# Altium project ControlePamis.PrjPcb
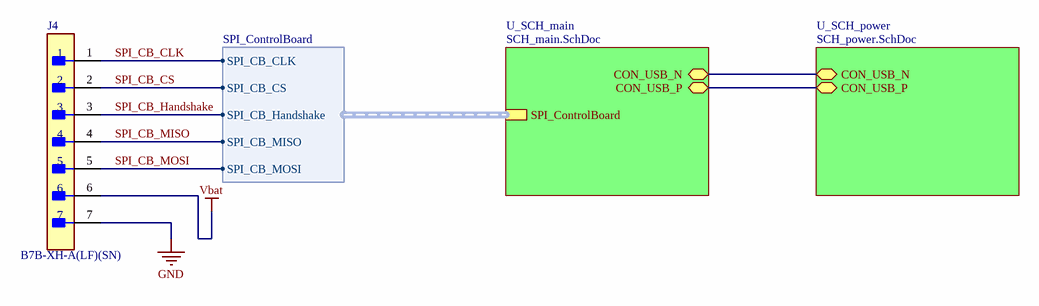
[diagram p0: Groupe_SCH.SchDoc]
3 sheets, 47 parts. Net scope: hierarchical (ports join the sheet entries above them; power ports are global).
Sheets:
  Groupe_SCH.SchDoc
    U_SCH_power = SCH_power.SchDoc
    U_SCH_main = SCH_main.SchDoc

## Sheet Groupe_SCH.SchDoc: Brain Board
size 297 x 209 mm; DrawnBy: Adnan CATAL; SheetNumber: 1; SheetTotal: 1; Designer: Adnan CATAL; Projet: Pamis; Title2: Main shematics

### Parts
J4  B7B-XH-A(LF)(SN)  [FP-B7B-XH-A_LF_SN-MFG]

### Sub-sheets
U_SCH_main = SCH_main.SchDoc: SPI_ControlBoard (harness SPI_ControlBoard), CON_USB_P (bidir), CON_USB_N (bidir)
U_SCH_power = SCH_power.SchDoc: CON_USB_P (bidir), CON_USB_N (bidir)

### Harnesses
SPI_ControlBoard: SPI_CB_CLK, SPI_CB_CS, SPI_CB_Handshake, SPI_CB_MOSI, SPI_CB_MISO

### Nets
GND: J4.7
Vbat: J4.6
CON_USB_N: sheet U_SCH_power/CON_USB_N, sheet U_SCH_main/CON_USB_N
CON_USB_P: sheet U_SCH_power/CON_USB_P, sheet U_SCH_main/CON_USB_P
SPI_CB_CLK: J4.1 ; sheet U_SCH_main/SPI_ControlBoard.SPI_CB_CLK
SPI_CB_CS: J4.2 ; sheet U_SCH_main/SPI_ControlBoard.SPI_CB_CS
SPI_CB_Handshake: J4.3 ; sheet U_SCH_main/SPI_ControlBoard.SPI_CB_Handshake
SPI_CB_MISO: J4.4 ; sheet U_SCH_main/SPI_ControlBoard.SPI_CB_MISO
SPI_CB_MOSI: J4.5 ; sheet U_SCH_main/SPI_ControlBoard.SPI_CB_MOSI

### Notes on the sheet
- Project/Equipment
- Document
- Designer
- Drawn by
- Check.by
- File
- Last Mod.
- Print Date
- Sheet
- of
- Size
- A4
- Rev

### Library data of the parts
J4 = CMP-17439-000323-2: CONN HEADER VERT 7POS 2.5MM; Current Rating: 3A; Voltage Rating: 250V; Number of Contacts: 7; Mated Stacking Heights: 9.8mm; Insulation Resistance: 1GR; Contact Resistance: 20mR; Wire/Cable Gauge: 22AWG; Contact Finish - Mating: TIN; Orientation: Straight; REACH SVHC: No SVHC; Max Operating Temperature: 85°C; Housing Color: White; Pitch: 2.5mm; Mount: Through Hole; Packaging: Bulk; Depth: 5.75mm; Series: XH; Min Operating Temperature: -25°C; Length: 19.9mm; Connector Type: Header; Number of Positions: 7; Color: Natural; Max Current Rating: 3A; Lead Pitch: 2.5mm; Termination: Solder; Fastening Type: Detent; Flammability Rating: UL94 V-0; Voltage Rating (AC): 250V; Lead Free: Lead Free; Contact Material: Brass; Max Voltage Rating (AC): 250V; Contact Type: Male Pin; Housing Material: Polyamide; Insulation Color: Natural; Contact Shape: Square; Number of Rows: 1; Contact Plating: Tin; Insulation Material: Nylon

## Sheet SCH_power.SchDoc: Brain Board
size 297 x 209 mm; SPICEModelCacheCRLNPAUY: <root> / <DocumentId>CRLNPAUY</DocumentId> / </root>; CreateDate: 26/10/2026; Projet: Pamis; DrawnBy: Adnan CATAL; SheetNumber: 1; SheetTotal: 1; Designer: Adnan CATAL; Title2: Power Schematic
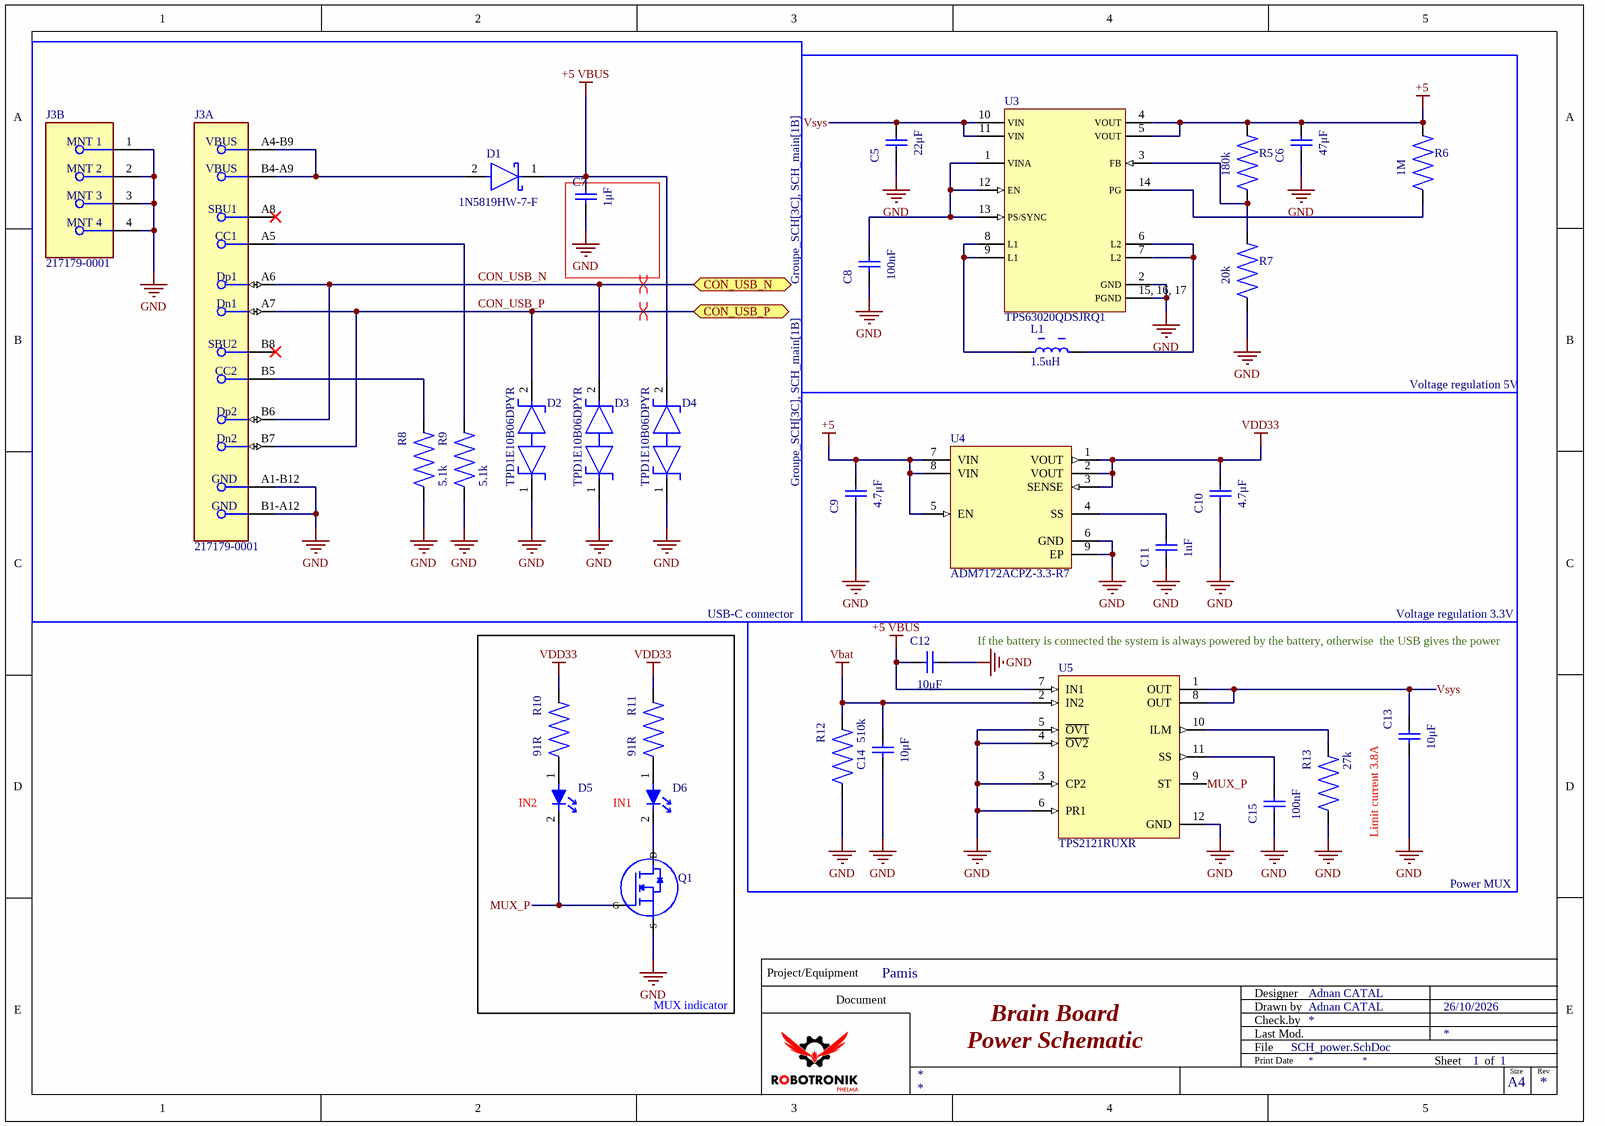
[diagram p1: SCH_power.SchDoc]

### Parts
C5  22μF  [WCAP-CSGP_0805_L2W1.25H1.25]
C6  47μF  [WCAP-CSGP_0805_L2W1.25H1.25]
C7  1μF  [WCAP-CSGP_0603_L1.6W0.8H0.8_Reflow]
C8  100nF  [WCAP-CSGP_0805_L2W1.25H0.8_Reflow]
C9  4.7μF  [WCAP-CSGP_0603_L1.6W0.8H0.8_Reflow]
C10  4.7μF  [WCAP-CSGP_0603_L1.6W0.8H0.8_Reflow]
C11  1nF  [WCAP-CSGP_0603_L1.6W0.8H0.8_Reflow]
C12  10μF  [WCAP-CSGP_0805_L2W1.25H1.25]
C13  10μF  [WCAP-CSGP_0805_L2W1.25H1.25]
C14  10μF  [WCAP-CSGP_0805_L2W1.25H1.25]
C15  100nF  [WCAP-CSGP_0805_L2W1.25H0.8_Reflow]
D1  1N5819HW-7-F  [FP-SOD123-IPC_A]
D2  TPD1E10B06DPYR  [FP-DPY0002A-MFG]
D3  TPD1E10B06DPYR  [FP-DPY0002A-MFG]
D4  TPD1E10B06DPYR  [FP-DPY0002A-MFG]
D5  Yellow Green  [DIOC2012X30N]  (value not drawn)
D6  Yellow Green  [DIOC2012X30N]  (value not drawn)
J3  217179-0001  [FP-2171790001-MFG]  (parts A,B of 2)
L1  1.5uH  [78438336015HT]
Q1  DMN2058U-7  [SOT90P240X110-3N]  (value not drawn)
R5  180k  [RESC1608X06N]
R6  1M  [RESC1608X06N]
R7  20k  [RESC1608X06N]
R8  5.1k  [RESC1608X06N]
R9  5.1k  [RESC1608X06N]
R10  91R  [RESC1608X06N]
R11  91R  [RESC1608X06N]
R12  510k  [RESC1608X06N]
R13  27k  [RESC1608X06N]
U3  TPS63020QDSJRQ1  [SON50P300X400X100-15N]
U4  ADM7172ACPZ-3.3-R7  [SON50P300X300X80-9N]
U5  TPS2121RUXR  [IC_TPS2121RUXR]

### Ports
CON_USB_N (bidir, see Groupe_SCH[3C], SCH_main[1B]), CON_USB_P (bidir, see Groupe_SCH[3C], SCH_main[1B])

### Nets
+5: C6.2 C9.2 R5.2 R6.2 U3.4(VOUT) U3.5(VOUT) U4.5(EN) U4.7(VIN) U4.8(VIN)
+5 VBUS: C7.2 C12.1 D1.1(C) D4.2 U5.7(IN1)
GND: C5.1 C6.1 C7.1 C8.1 C9.1 C10.1 C11.1 C12.2 C13.1 C14.1 C15.1 D2.1 D3.1 D4.1 J3.1(MNT_1) J3.2(MNT_2) J3.3(MNT_3) J3.4(MNT_4) J3.A1-B12(GND) J3.B1-A12(GND) Q1.2(S) R7.1 R8.1 R9.1 R12.1 R13.1 U3.2(GND) U3.15,_16,_17(PGND) U4.6(GND) U4.9(EP) U5.3(CP2) U5.4(~{OV2}) U5.5(~{OV1}) U5.6(PR1) U5.12(GND)
Vbat: C14.2 R12.2 U5.2(IN2)
VDD33: C10.2 R10.2 R11.2 U4.1(VOUT) U4.2(VOUT) U4.3(SENSE)
CON_USB_N: D3.2 J3.A6(Dp1) J3.B6(Dp2) ; port CON_USB_N
CON_USB_P: D2.2 J3.A7(Dn1) J3.B7(Dn2) ; port CON_USB_P
MUX_P: D5.2 Q1.1(G) U5.9(ST)
Vsys: C5.2 C13.2 U3.10(VIN) U3.11(VIN) U5.1(OUT) U5.8(OUT)
NetC8_2: C8.2 U3.1(VINA) U3.12(EN) U3.13(PS/SYNC)
NetC11_2: C11.2 U4.4(SS)
NetC15_2: C15.2 U5.11(SS)
NetD1_2: D1.2(A) J3.A4-B9(VBUS) J3.B4-A9(VBUS)
NetD5_1: D5.1 R10.1
NetD6_1: D6.1 R11.1
NetD6_2: D6.2 Q1.3(D)
NetJ3_A5: J3.A5(CC1) R9.2
NetJ3_B5: J3.B5(CC2) R8.2
NetL1_1: L1.1 U3.8(L1) U3.9(L1)
NetL1_2: L1.2 U3.6(L2) U3.7(L2)
NetR5_1: R5.1 R7.2 U3.3(FB)
NetR6_1: R6.1 U3.14(PG)
NetR13_2: R13.2 U5.10(ILM)

Not connected (* = marked no-connect by the designer): J3 A8(SBU1)* B8(SBU2)*

### Layout directives
differential pair; differential pair class DIFF_USB: CON_USB_N, CON_USB_P

### Notes on the sheet
- Voltage regulation 5V
- USB-C connector
- If the battery is connected the system is always powered by the battery, otherwise  the USB gives the power
- Voltage regulation 3.3V
- (near D5) IN2
- (near D6) IN1
- Limit current 3.8A
- Power MUX
- MUX indicator
- Project/Equipment
- Document
- Designer
- Drawn by
- Check.by
- File
- Last Mod.
- Print Date
- Sheet
- of
- Size
- A4
- Rev

### Library data of the parts
C5 = 885012107019: WCAP-CSGP Multilayer Ceramic Chip Capacitor, General Purpose, size 0805, 22μF, 25V; Manufacturer: Wurth Elektronik; Case/Size Code: 0805; Capacitance Tolerance: +/-20%; Ceramic Type: X5R Class II; Dissipation Factor: 10%; Insulation Resistance: 0.002GΩ; Technical Reference: X5R0805226M025DFCT10000; Manufacturer Part Number: 885012107019; Category: Multilayer Ceramic Chip Capacitors; Match Code: WCAP-CSGP; ComponentLink1Description: Website Link; ComponentLink1URL: https://www.we-online.com/redexpert/article/885012107019?ad; ComponentLink2Description: Datasheet Link; ComponentLink2URL: https://www.we-online.com/redexpert/spec/885012107019?ad; Mount: Surface Mount; Min Operating Temperature: -55°C; Max Operating Temperature: 85°C; Packaging: Tape and Reel; Length: 2mm; Width: 1.25mm; Height: 1.25mm; Capacitance: 22μF; Rated Voltage (DC): 25V
C6 = 885012107006: WCAP-CSGP Multilayer Ceramic Chip Capacitor, General Purpose, size 0805, 47μF, 6.3V; Manufacturer: Wurth Elektronik; Case/Size Code: 0805; Capacitance Tolerance: +/-20%; Ceramic Type: X5R; Dissipation Factor: 10%; Insulation Resistance: 0.002GΩ; Technical Reference: X5R0805476M6R3DFCT10000; Manufacturer Part Number: 885012107006; Category: Multilayer Ceramic Chip Capacitors; Match Code: WCAP-CSGP; ComponentLink1Description: Website Link; ComponentLink1URL: https://www.we-online.com/redexpert/article/885012107006?ad; ComponentLink2Description: Datasheet Link; ComponentLink2URL: https://www.we-online.com/redexpert/spec/885012107006?ad; Mount: Surface Mount; Min Operating Temperature: -55°C; Max Operating Temperature: 85°C; Packaging: Tape and Reel; Length: 2mm; Width: 1.25mm; Height: 1.25mm; Capacitance: 47μF; Rated Voltage (DC): 6.3V
C7 = 885012106003: WCAP-CSGP Multilayer Ceramic Chip Capacitor, General Purpose, size 0603, 1μF, 6.3V; Manufacturer: Wurth Elektronik; Case/Size Code: 0603; Capacitance Tolerance: +/-20%; Ceramic Type: X5R; Dissipation Factor: 10%; Insulation Resistance: 0.1GΩ; Technical Reference: X5R0603105M6R3DFCT10000; Manufacturer Part Number: 885012106003; Category: Multilayer Ceramic Chip Capacitors; Match Code: WCAP-CSGP; ComponentLink1Description: Website Link; ComponentLink1URL: https://www.we-online.com/redexpert/article/885012106003?ad; ComponentLink2Description: Datasheet Link; ComponentLink2URL: https://www.we-online.com/redexpert/spec/885012106003?ad; Mount: Surface Mount; Min Operating Temperature: -55°C; Max Operating Temperature: 85°C; Packaging: Tape and Reel; Length: 1.6mm; Width: 0.8mm; Height: 0.8mm; Capacitance: 1μF; Rated Voltage (DC): 6.3V
C8 C15 = 885012207045: WCAP-CSGP Multilayer Ceramic Chip Capacitor, General Purpose, size 0805, 100nF, 16V; Manufacturer: Wurth Elektronik; Case/Size Code: 0805; Capacitance Tolerance: +/-10%; Ceramic Type: X7R; Dissipation Factor: 3.5%; Insulation Resistance: 5GΩ; Technical Reference: X7R0805104K016DFCT10000; Manufacturer Part Number: 885012207045; Category: Multilayer Ceramic Chip Capacitors; Match Code: WCAP-CSGP; ComponentLink1Description: Website Link; ComponentLink1URL: https://www.we-online.com/redexpert/article/885012207045?ad; ComponentLink2Description: Datasheet Link; ComponentLink2URL: https://www.we-online.com/redexpert/spec/885012207045?ad; Mount: Surface Mount; Min Operating Temperature: -55°C; Max Operating Temperature: 125°C; Packaging: Tape and Reel; Length: 2mm; Width: 1.25mm; Height: 0.8mm; Capacitance: 100nF; Rated Voltage (DC): 16V
C9 C10 = 885012106012: WCAP-CSGP Multilayer Ceramic Chip Capacitor, General Purpose, size 0603, 4.7μF, 10V; Manufacturer: Wurth Elektronik; Case/Size Code: 0603; Capacitance Tolerance: +/-20%; Ceramic Type: X5R; Dissipation Factor: 10%; Insulation Resistance: 0.02GΩ; Technical Reference: X5R0603475M010DFCT10000; Manufacturer Part Number: 885012106012; Category: Multilayer Ceramic Chip Capacitors; Match Code: WCAP-CSGP; ComponentLink1Description: Website Link; ComponentLink1URL: https://www.we-online.com/redexpert/article/885012106012?ad; ComponentLink2Description: Datasheet Link; ComponentLink2URL: https://www.we-online.com/redexpert/spec/885012106012?ad; Mount: Surface Mount; Min Operating Temperature: -55°C; Max Operating Temperature: 85°C; Packaging: Tape and Reel; Length: 1.6mm; Width: 0.8mm; Height: 0.8mm; Capacitance: 4.7μF; Rated Voltage (DC): 10V
C11 = 885012006029: WCAP-CSGP Multilayer Ceramic Chip Capacitor, General Purpose, size 0603, 1nF, 16V; Manufacturer: Wurth Elektronik; Case/Size Code: 0603; Capacitance Tolerance: +/-5%; Ceramic Type: NP0; Insulation Resistance: 10GΩ; Q Factor: 1000; Technical Reference: NP00603102J016DFCT10000; Manufacturer Part Number: 885012006029; Category: Multilayer Ceramic Chip Capacitors; Match Code: WCAP-CSGP; ComponentLink1Description: Website Link; ComponentLink1URL: https://www.we-online.com/redexpert/article/885012006029?ad; ComponentLink2Description: Datasheet Link; ComponentLink2URL: https://www.we-online.com/redexpert/spec/885012006029?ad; Mount: Surface Mount; Min Operating Temperature: -55°C; Max Operating Temperature: 125°C; Packaging: Tape and Reel; Length: 1.6mm; Width: 0.8mm; Height: 0.8mm; Capacitance: 1nF; Rated Voltage (DC): 16V
C12-C14 = 885012107027: WCAP-CSGP Multilayer Ceramic Chip Capacitor, General Purpose, size 0805, 10μF, 25V; Manufacturer: Wurth Elektronik; Case/Size Code: 0805; Capacitance Tolerance: +/-10%; Ceramic Type: X5R Class II; Dissipation Factor: 12.5%; Insulation Resistance: 0.005GΩ; Technical Reference: X5R0805106K025DFCT10000; Manufacturer Part Number: 885012107027; Category: Multilayer Ceramic Chip Capacitors; Match Code: WCAP-CSGP; ComponentLink1Description: Website Link; ComponentLink1URL: https://www.we-online.com/redexpert/article/885012107027?ad; ComponentLink2Description: Datasheet Link; ComponentLink2URL: https://www.we-online.com/redexpert/spec/885012107027?ad; Mount: Surface Mount; Min Operating Temperature: -55°C; Max Operating Temperature: 85°C; Packaging: Tape and Reel; Length: 2mm; Width: 1.25mm; Height: 1.25mm; Capacitance: 10μF; Rated Voltage (DC): 25V
D1 = CMP-0303-00003-3: DIODE SCHOTTKY 40V 1A SOD123; Forward Voltage: 450mV; Capacitance: 110pF; Max Forward Surge Current (Ifsm): 25A; Peak Reverse Current: 50uA; Polarity: Standard; Element Configuration: Single; Max Power Dissipation: 450mW; Min Operating Temperature: -65°C; Package Quantity: 3000; Contact Plating: Tin; Weight: 0.000353oz; Max Repetitive Reverse Voltage (Vrrm): 40V; Max Reverse Voltage (DC): 40V; Height: 1.25mm; Average Rectified Current: 1A; Width: 1.7mm; Case/Package: SOD-123-2; Lead Free: Lead Free; Max Operating Temperature: 125°C; Current Rating: 1A; Termination: SMD/SMT; Forward Current: 1A; Radiation Hardening: No; Number of Pins: 2; Length: 2.85mm; Voltage Rating (DC): 40V; REACH SVHC: No SVHC; Peak Non-Repetitive Surge Current: 25A; Packaging: Tape and Reel; Output Current: 1A
D2-D4 = CMP-0326-00004-4: TVS DIODE 5.5V 14V 2X1SON; Leakage Current: 100nA; Min Breakdown Voltage: 6V; Number of Channels: 1; ESD Protection: Yes; Power Line Protection: No; Test Current: 1mA; Interface: GPIO; Element Configuration: Single; Peak Pulse Current: 5A; Direction: Bidirectional; Peak Pulse Power: 90W; Capacitance: 12pF; Composition: Zener; Packaging: Tape and Reel; Number of Pins: 2; Breakdown Voltage: 6V; Radiation Hardening: No; Min Operating Temperature: -40°C; Contact Plating: Gold; Lead Free: Lead Free; Height: 0.35mm; REACH SVHC: No SVHC; Case/Package: 0402; Max Operating Temperature: 125°C; Width: 0.7mm; Clamping Voltage: 14V; Package Quantity: 1; Max Reverse Leakage Current: 100nA; Working Voltage: 5.5V; Length: 1.1mm; Number of Bidirectional Channels: 1; Reverse Standoff Voltage: 5.5V
D5 D6 = 2545731: 573nm 120° 1.6V~2.4V Green Transparent Yellow SMD 2mm × 1.5mm; Manufacturer: RS Pro; Supplier: RS; Supplier Part Number: 2545731; Manufacturer Part Number: 2545731; Category: LEDs; Stock: 7800; Pricing: 50=0,038, 250=0,037, 500=0,034, 1250=0,03, 5000=0,022 (EUR); Harmonized Tariff Schedule (HTS) Code: 8541.40.20.00; Introduction Date: 2022-12-15
J3 = CMP-04767-000028-2: CONN RCP USB2.0 TYP C 24P SMD RA; NexarPartId: 117190526; Gender: Receptacle; Number of Contacts: 16; Current Rating: 1.25A; Voltage Rating: 30V; Min Operating Temperature: -40°C; USB Standard: USB 2.0; Height: 3.36mm; Contact Material: Gold, Nickel; Max Operating Temperature: 85°C
L1 = 78438336015HT: Power Inductor, 1.5UH, 5.2A, Shielded Rohs Compliant: Yes; Manufacturer: Wurth Elektronik; Supplier: RS; Supplier Part Number: 426953; Manufacturer Part Number: 78438336015HT; Category: Fixed Inductors; Stock: 1000; Pricing: 5=2,106, 50=2, 100=1,854, 500=1,706 (EUR)
Q1 = DMN2058U-7: Diodes Zetex DMN2058U N-Channel MOSFET, Vds=20 V, 4.6 A, SOT-23, SMD, 3-Pin; Manufacturer: Diodes Inc.; Continuous Drain Current (ID): 4.6A; Drain to Source Resistance: 35mΩ; Drain to Source Voltage (Vds): 20V; Max Power Dissipation: 1.13W; Number of Elements: 1; Supplier: RS; Supplier Part Number: 1333377; Manufacturer Part Number: DMN2058U-7; RoHS: Compliant; Category: MOSFETs; Stock: 16000; Pricing: 50=0,225 (EUR); Case/Package: SOT-23; China RoHS: Compliant; Country of Origin: Mainland China; Export Control Classification Number (ECCN) Code: EAR99; Introduction Date: 2016-09-13; Lifecycle Status: Production; Max Operating Temperature: 150°C; Min Breakdown Voltage: 20V; Min Operating Temperature: -55°C; Number of Terminals: 3; REACH SVHC: Unaffected; Schedule B: 8541290080, 8541290080|8541290080|8541290080|8541290080|8541290080; ComponentLink1URL: https://datasheet.octopart.com:443/DMN2058U-7-Diodes-Inc.-datasheet-180553089.pdf?src-supplier=Newark; ComponentLink1Description: https://datasheet.octopart.com:443/DMN2058U-7-Diodes-Inc.-datasheet-180553089.pdf?src-supplier=Newark; ComponentLink2URL: https://datasheet.octopart.com:443/DMN2058U-7-Diodes-Inc.-datasheet-76801221.pdf?src-supplier=Newark; ComponentLink2Description: https://datasheet.octopart.com:443/DMN2058U-7-Diodes-Inc.-datasheet-76801221.pdf?src-supplier=Newark; ComponentLink3URL: https://datasheet.octopart.com:443/DMN2058U-7-Diodes-Inc.-datasheet-128204454.pdf?src-supplier=TME; ComponentLink3Description: https://datasheet.octopart.com:443/DMN2058U-7-Diodes-Inc.-datasheet-128204454.pdf?src-supplier=TME; ComponentLink4URL: https://sigma.octopart.com:443/138706058/technical_drawing/Diodes-Inc.-DMN2058U-7.pdf?src-supplier=Diodes+Inc+SCT; ComponentLink4Description: https://sigma.octopart.com:443/138706058/technical_drawing/Diodes-Inc.-DMN2058U-7.pdf?src-supplier=Diodes+Inc+SCT
R5 = Resistance 180k 0603 1%: Tolerance: 1%; Power (W): 0,1; Description: Resistance 180k 0603 1%; Value: 180k; Package: 0603
R6 = Resistance 1M 0603 1%: Tolerance: 1%; Power (W): 0,1; Description: Resistance 1M 0603 1%; Value: 1M; Package: 0603
R7 = Resistance 20k 0603 1%: Tolerance: 1%; Power (W): 0,1; Description: Resistance 20k 0603 1%; Value: 20k; Package: 0603
R8 R9 = Resistance 5.1k 0603 1%: Tolerance: 1%; Power (W): 0,1; Description: Resistance 5.1k 0603 1%; Value: 5.1k; Package: 0603
R10 R11 = Resistance 91R 0603 1%: Tolerance: 1%; Power (W): 0,1; Description: Resistance 91R 0603 1%; Value: 91R; Package: 0603
R12 = Resistance 510k 0603 1%: Tolerance: 1%; Power (W): 0,1; Description: Resistance 510k 0603 1%; Value: 510k; Package: 0603
R13 = Resistance 27k 0603 1%: Tolerance: 1%; Power (W): 0,1; Description: Resistance 27k 0603 1%; Value: 27k; Package: 0603
U3 = TPS63020QDSJRQ1: Switching Regulator, Current-mode, 2A, 2600kHz Switching Freq-Max, BICMOS, PDSO14; Manufacturer: Texas Instruments; Manufacturer Lifecycle Status: ACTIVE; Max Duty Cycle: 100%; Max Supply Voltage: 5.5V; Max Junction Temperature (Tj): 125°C; Min Input Voltage: 1.8V; Min Output Voltage: 1.2V; Number of Outputs: 1; Output Configuration: Positive; Output Type: Adjustable; Quiescent Current: 50µA; Switching Frequency: 2.4MHz; Synchronous Rectifier: Yes; Topology: Buck-Boost; Supplier: DigiKey; Supplier Part Number: 296-43286-1-ND; Manufacturer Part Number: TPS63020QDSJRQ1; RoHS: Compliant; Category: Voltage Regulators - Switching; Stock: 2665; Height: 1mm; Lead Free: Lead Free; Length: 3mm; Lifecycle Status: Production; Max Operating Temperature: 125°C; Max Output Voltage: 5.5V; Min Operating Temperature: -40°C; Min Supply Voltage: 1.8V; Mounting Technology: Surface Mount; Pins: 14; Output Current: 2A; Packaging: Tape & Reel (TR); Schedule B: 8542390000; Thickness: 900µm; Width: 4mm; ComponentLink1URL: https://datasheet.octopart.com:443/TPS63020QDSJRQ1-Texas-Instruments-datasheet-49823712.pdf?src-supplier=Texas+Instruments; ComponentLink1Description: https://datasheet.octopart.com:443/TPS63020QDSJRQ1-Texas-Instruments-datasheet-49823712.pdf?src-supplier=Texas+Instruments; ComponentLink2URL: https://octopart.com:443/opatz8j6/c1?t=_PlhL9x2DhC5kj_RspDZiegst2Pjcy_9vSA66_zuppjomAtxh8eeCyEWgMGgfXy8gLa5JUP9H_sFY7m0oo4wV1IqgyNWPgIvJJupqtj6dfd8itVF4uXJuBAZm-8-5KdURT-rscAAk4exrppObfuTgysDWqXYCWa6g4Er1_Yh9dDDJDseR-GA9P54EzHN3SPr7356tuSvadfqr47za5CxFVn9TQNg0n6ftYFjG23QVqjVCqxpDU9_do17Rge9-GpcbffJGRMgW8xBeG-p9jOxI28gxcA3t1lsqEAUe8NkT9T-De4ixHPzJWQdEQ21idKCidjl-nWmjapctRLk1RCL25uQiA4SFrXYm9BPX9ccWOLSYwzhdM6cw773HQiK6sNIWq2y8fEWUQ-w&src-supplier=Texas+Instruments; ComponentLink2Description: https://octopart.com:443/opatz8j6/c1?t=_PlhL9x2DhC5kj_RspDZiegst2Pjcy_9vSA66_zuppjomAtxh8eeCyEWgMGgfXy8gLa5JUP9H_sFY7m0oo4wV1IqgyNWPgIvJJupqtj6dfd8itVF4uXJuBAZm-8-5KdURT-rscAAk4exrppObfuTgysDWqXYCWa6g4Er1_Yh9dDDJDseR-GA9P54EzHN3SPr7356tuSvadfqr47za5CxFVn9TQNg0n6ftYFjG23QVqjVCqxpDU9_do17Rge9-GpcbffJGRMgW8xBeG-p9jOxI28gxcA3t1lsqEAUe8NkT9T-De4ixHPzJWQdEQ21idKCidjl-nWmjapctRLk1RCL25uQiA4SFrXYm9BPX9ccWOLSYwzhdM6cw773HQiK6sNIWq2y8fEWUQ-w&src-supplier=Texas+Instruments; ComponentLink3URL: https://sigma.octopart.com:443/49262683/technical_drawing/Texas-Instruments-TPS63020QDSJRQ1.pdf?src-supplier=Texas+Instruments; ComponentLink3Description: https://sigma.octopart.com:443/49262683/technical_drawing/Texas-Instruments-TPS63020QDSJRQ1.pdf?src-supplier=Texas+Instruments; ComponentLink4URL: https://datasheet.octopart.com:443/TPS63020QDSJRQ1-Texas-Instruments-datasheet-164483805.pdf?src-supplier=LCSC; ComponentLink4Description: https://datasheet.octopart.com:443/TPS63020QDSJRQ1-Texas-Instruments-datasheet-164483805.pdf?src-supplier=LCSC; ComponentLink5URL: https://datasheet.octopart.com:443/TPS63020QDSJRQ1-Texas-Instruments-datasheet-147652911.pdf?src-supplier=Arrow.cn; ComponentLink5Description: https://datasheet.octopart.com:443/TPS63020QDSJRQ1-Texas-Instruments-datasheet-147652911.pdf?src-supplier=Arrow.cn; ComponentLink6URL: http://sigma.octopart.com:80/reach_statement/Texas-Instruments-company-64.pdf?src-supplier=Compliance+Statements; ComponentLink6Description: http://sigma.octopart.com:80/reach_statement/Texas-Instruments-company-64.pdf?src-supplier=Compliance+Statements; ComponentLink7URL: http://sigma.octopart.com:80/conflict_mineral_statement/Texas-Instruments-company-63.pdf?src-supplier=Compliance+Statements; ComponentLink7Description: http://sigma.octopart.com:80/conflict_mineral_statement/Texas-Instruments-company-63.pdf?src-supplier=Compliance+Statements
U4 = ADM7172ACPZ-3.3-R7: LDO Regulator Pos 3.3V 2A Medical 8-Pin LFCSP EP T/R; Manufacturer: Analog Devices; Manufacturer Lifecycle Status: PRODUCTION; Accuracy: 1.5%; Dropout Voltage: 172mV; Max Supply Voltage: 6.5V; Max Junction Temperature (Tj): 125°C; Min Current Limit: 2.4A; Min Input Voltage: 2.3V; Number of Outputs: 1; Output Type: Fixed; Polarity: Positive; Quiescent Current: 700µA; Supplier: DigiKey; Supplier Part Number: 505-ADM7172ACPZ-3.3-R7CT-ND; Manufacturer Part Number: ADM7172ACPZ-3.3-R7; RoHS: Compliant; Category: Voltage Regulators - Linear; Stock: 650; Height: 800µm; Lead Free: Contains Lead; Lifecycle Status: Production; Max Operating Temperature: 125°C; Max Output current: 2A; Min Operating Temperature: -40°C; Min Supply Voltage: 2.3V; Mounting Technology: Surface Mount; Pins: 8; Number of Regulators: 1; Output Current: 2A; Output Voltage: 3.3V; Schedule B: 8542390000, 8542390000|8542390000|8542390000|8542390000|8542390000|8542390000|8542390000|8542390000|8542390000|8542390000|8542390000|8542390000|8542390000|8542390000|8542390000|8542390000|8542390000|8542390000|8542390000|8542390000|8542390000|8542390000|8542390000|85; ComponentLink1URL: https://octopart.com:443/opatz8j6/c1?t=bexnlEUvTW4ypcfmMwlQqMukjbZ1sFR7u3HjvhF_p0I1qGgozQEmLYCO0KwwxyEbZiH-eJUsaq8roSbEQNHeTfmOLjlUalTxX2N5GzImcnPMgEcSznHyXIFAgYBb3OUFi_TCl-xASKxKL_mduVIwpazwMBHKV180gVIIaW80selJWFwC_3dSvsH907UDuDBRMF5w27S6ay03f3bc-2j1dmxAk8VGKHozbFK1-BDI5ZbzN8PLYE5HGUZO9k9f8snk51CSxxJCoL8hJ4y85Qa6ezUbzh37DwBqbNGjHclmawiQR9L4M29XjpI&src-supplier=Analog+Devices; ComponentLink1Description: https://octopart.com:443/opatz8j6/c1?t=bexnlEUvTW4ypcfmMwlQqMukjbZ1sFR7u3HjvhF_p0I1qGgozQEmLYCO0KwwxyEbZiH-eJUsaq8roSbEQNHeTfmOLjlUalTxX2N5GzImcnPMgEcSznHyXIFAgYBb3OUFi_TCl-xASKxKL_mduVIwpazwMBHKV180gVIIaW80selJWFwC_3dSvsH907UDuDBRMF5w27S6ay03f3bc-2j1dmxAk8VGKHozbFK1-BDI5ZbzN8PLYE5HGUZO9k9f8snk51CSxxJCoL8hJ4y85Qa6ezUbzh37DwBqbNGjHclmawiQR9L4M29XjpI&src-supplier=Analog+Devices; ComponentLink2URL: https://datasheet.octopart.com:443/ADM7172ACPZ-3.3-R7-Analog-Devices-datasheet-48279025.pdf?src-supplier=Analog+Devices; ComponentLink2Description: https://datasheet.octopart.com:443/ADM7172ACPZ-3.3-R7-Analog-Devices-datasheet-48279025.pdf?src-supplier=Analog+Devices; ComponentLink3URL: https://datasheet.octopart.com:443/ADM7172ACPZ-3.3-R7-Analog-Devices-datasheet-38520329.pdf?src-supplier=Analog+Devices; ComponentLink3Description: https://datasheet.octopart.com:443/ADM7172ACPZ-3.3-R7-Analog-Devices-datasheet-38520329.pdf?src-supplier=Analog+Devices; ComponentLink4URL: https://datasheet.octopart.com:443/ADM7172ACPZ-3.3-R7-Analog-Devices-datasheet-28823778.pdf?src-supplier=Analog+Devices; ComponentLink4Description: https://datasheet.octopart.com:443/ADM7172ACPZ-3.3-R7-Analog-Devices-datasheet-28823778.pdf?src-supplier=Analog+Devices; ComponentLink5URL: https://datasheet.octopart.com:443/ADM7172ACPZ-3.3-R7-Analog-Devices-datasheet-138896285.pdf?src-supplier=element14+APAC; ComponentLink5Description: https://datasheet.octopart.com:443/ADM7172ACPZ-3.3-R7-Analog-Devices-datasheet-138896285.pdf?src-supplier=element14+APAC; ComponentLink6URL: https://datasheet.octopart.com:443/ADM7172ACPZ-3.3-R7-Analog-Devices-datasheet-65849620.pdf?src-supplier=Farnell; ComponentLink6Description: https://datasheet.octopart.com:443/ADM7172ACPZ-3.3-R7-Analog-Devices-datasheet-65849620.pdf?src-supplier=Farnell; ComponentLink7URL: https://datasheet.octopart.com:443/ADM7172ACPZ-3.3-R7-Analog-Devices-datasheet-85391316.pdf?src-supplier=Augswan; ComponentLink7Description: https://datasheet.octopart.com:443/ADM7172ACPZ-3.3-R7-Analog-Devices-datasheet-85391316.pdf?src-supplier=Augswan; ComponentLink8URL: http://sigma.octopart.com:80/conflict_mineral_statement/Analog-Devices-company-33.pdf?src-supplier=Compliance+Statements; ComponentLink8Description: http://sigma.octopart.com:80/conflict_mineral_statement/Analog-Devices-company-33.pdf?src-supplier=Compliance+Statements; ComponentLink9URL: https://octopart.com:443/opatz8j6/c1?t=HP60T0laTHBr78PKNnBwM6RqgywCZdwDfs00A3_xvPXBlGZMB0MdxiYSNcNKfNWJXXZOlJEZQVeS8sOHWC_yzBqUXHUhuyAnEWhaxYA1OpH5fwwc5RqAQfGZuhPNXKQY3fp4_FYGdgOr9CJ69_o4g2M3JDXRpDLIoxiy_MvhA51uKxxlNiZkDQDLf5kNOadxR7lyBtK3STOEU-5RWzyenGvMvyyu3RhliVLg2Kl7XMJxgwTREY3xRC-2EhYST3IpebnuTZ5Sou7rm9ykF39dsCzAOMJd78Yclw1sa_MxoQ00ob-bF_4OtKU&src-supplier=Compliance+Statements; ComponentLink9Description: https://octopart.com:443/opatz8j6/c1?t=HP60T0laTHBr78PKNnBwM6RqgywCZdwDfs00A3_xvPXBlGZMB0MdxiYSNcNKfNWJXXZOlJEZQVeS8sOHWC_yzBqUXHUhuyAnEWhaxYA1OpH5fwwc5RqAQfGZuhPNXKQY3fp4_FYGdgOr9CJ69_o4g2M3JDXRpDLIoxiy_MvhA51uKxxlNiZkDQDLf5kNOadxR7lyBtK3STOEU-5RWzyenGvMvyyu3RhliVLg2Kl7XMJxgwTREY3xRC-2EhYST3IpebnuTZ5Sou7rm9ykF39dsCzAOMJd78Yclw1sa_MxoQ00ob-bF_4OtKU&src-supplier=Compliance+Statements
U5 = TPS2121RUXR: 2.7-V to 22-V, 56-mΩ, 4.5-A, power mux with seamless switchover 12-VQFN-HR -40 to 125; Manufacturer: Texas Instruments; Manufacturer Lifecycle Status: ACTIVE; Max Junction Temperature (Tj): 125°C; Max Supply Voltage: 22V; Min Supply Voltage: 2.8V; Nominal Supply Current: 300µA; Number of Outputs: 1; Supplier: DigiKey; Supplier Part Number: 296-53410-1-ND; Manufacturer Part Number: TPS2121RUXR; RoHS: Compliant; Category: Power Management ICs; Stock: 13790; Height: 1mm; Length: 2.5mm; Lifecycle Status: Production; Max Operating Temperature: 125°C; Min Operating Temperature: -40°C; Pins: 12; Output Voltage: 22V; Schedule B: 8542390000, 8542390000|8542390000|8542390000|8542390000|8542390000; Thickness: 900µm; Width: 2mm; ComponentLink1URL: https://octopart.com:443/opatz8j6/c1?t=UKnKZsbDBKkWsuyviuPWhg6xnyY8YIPWRq3cGxhkt1CfXZne3rjgNtb9c8HEeUytPaPKf7af2uzAM0G6eOMOkh2IkH16zphJoSKUG-6Ea_yYAOQ3gP18ORaWd8ahF6Zf8RmVsrCt4o_VwsBjooNgHxpDYNmJeLQlCByhaq_oTqRGdi7WpnjOt0tXJGP0F5fO4d8rhyA_djt6xZO7O4pJMBUW0eJFZLB1i-juaiql1BsYqxGr4NgutUQ6UwkoV3Xj_pIx-QhqZmSQhVum4Bj9ANjIamkSlAEGTqhin75-oCdQByKwn2rfzrP7MxY01-ZaYe5651WmC_B7txcOTqRcf7lt80iDfsYBE-b8NP8aazKY0bGgVcCP00e8bu-KKwkHkhoMuZ4&src-supplier=Texas+Instruments; ComponentLink1Description: https://octopart.com:443/opatz8j6/c1?t=UKnKZsbDBKkWsuyviuPWhg6xnyY8YIPWRq3cGxhkt1CfXZne3rjgNtb9c8HEeUytPaPKf7af2uzAM0G6eOMOkh2IkH16zphJoSKUG-6Ea_yYAOQ3gP18ORaWd8ahF6Zf8RmVsrCt4o_VwsBjooNgHxpDYNmJeLQlCByhaq_oTqRGdi7WpnjOt0tXJGP0F5fO4d8rhyA_djt6xZO7O4pJMBUW0eJFZLB1i-juaiql1BsYqxGr4NgutUQ6UwkoV3Xj_pIx-QhqZmSQhVum4Bj9ANjIamkSlAEGTqhin75-oCdQByKwn2rfzrP7MxY01-ZaYe5651WmC_B7txcOTqRcf7lt80iDfsYBE-b8NP8aazKY0bGgVcCP00e8bu-KKwkHkhoMuZ4&src-supplier=Texas+Instruments; ComponentLink2URL: http://sigma.octopart.com:80/reach_statement/Texas-Instruments-company-64.pdf?src-supplier=Compliance+Statements; ComponentLink2Description: http://sigma.octopart.com:80/reach_statement/Texas-Instruments-company-64.pdf?src-supplier=Compliance+Statements; ComponentLink3URL: http://sigma.octopart.com:80/conflict_mineral_statement/Texas-Instruments-company-63.pdf?src-supplier=Compliance+Statements; ComponentLink3Description: http://sigma.octopart.com:80/conflict_mineral_statement/Texas-Instruments-company-63.pdf?src-supplier=Compliance+Statements

## Sheet SCH_main.SchDoc: Brain Board
size 297 x 209 mm; SPICEModelCacheJUPSVLAV: <root> / <DocumentId>JUPSVLAV</DocumentId> / </root>; DrawnBy: Adnan CATAL; SheetNumber: 2; SheetTotal: 3; Designer: Adnan CATAL; Projet: Pamis; Title2: MCU Schematic
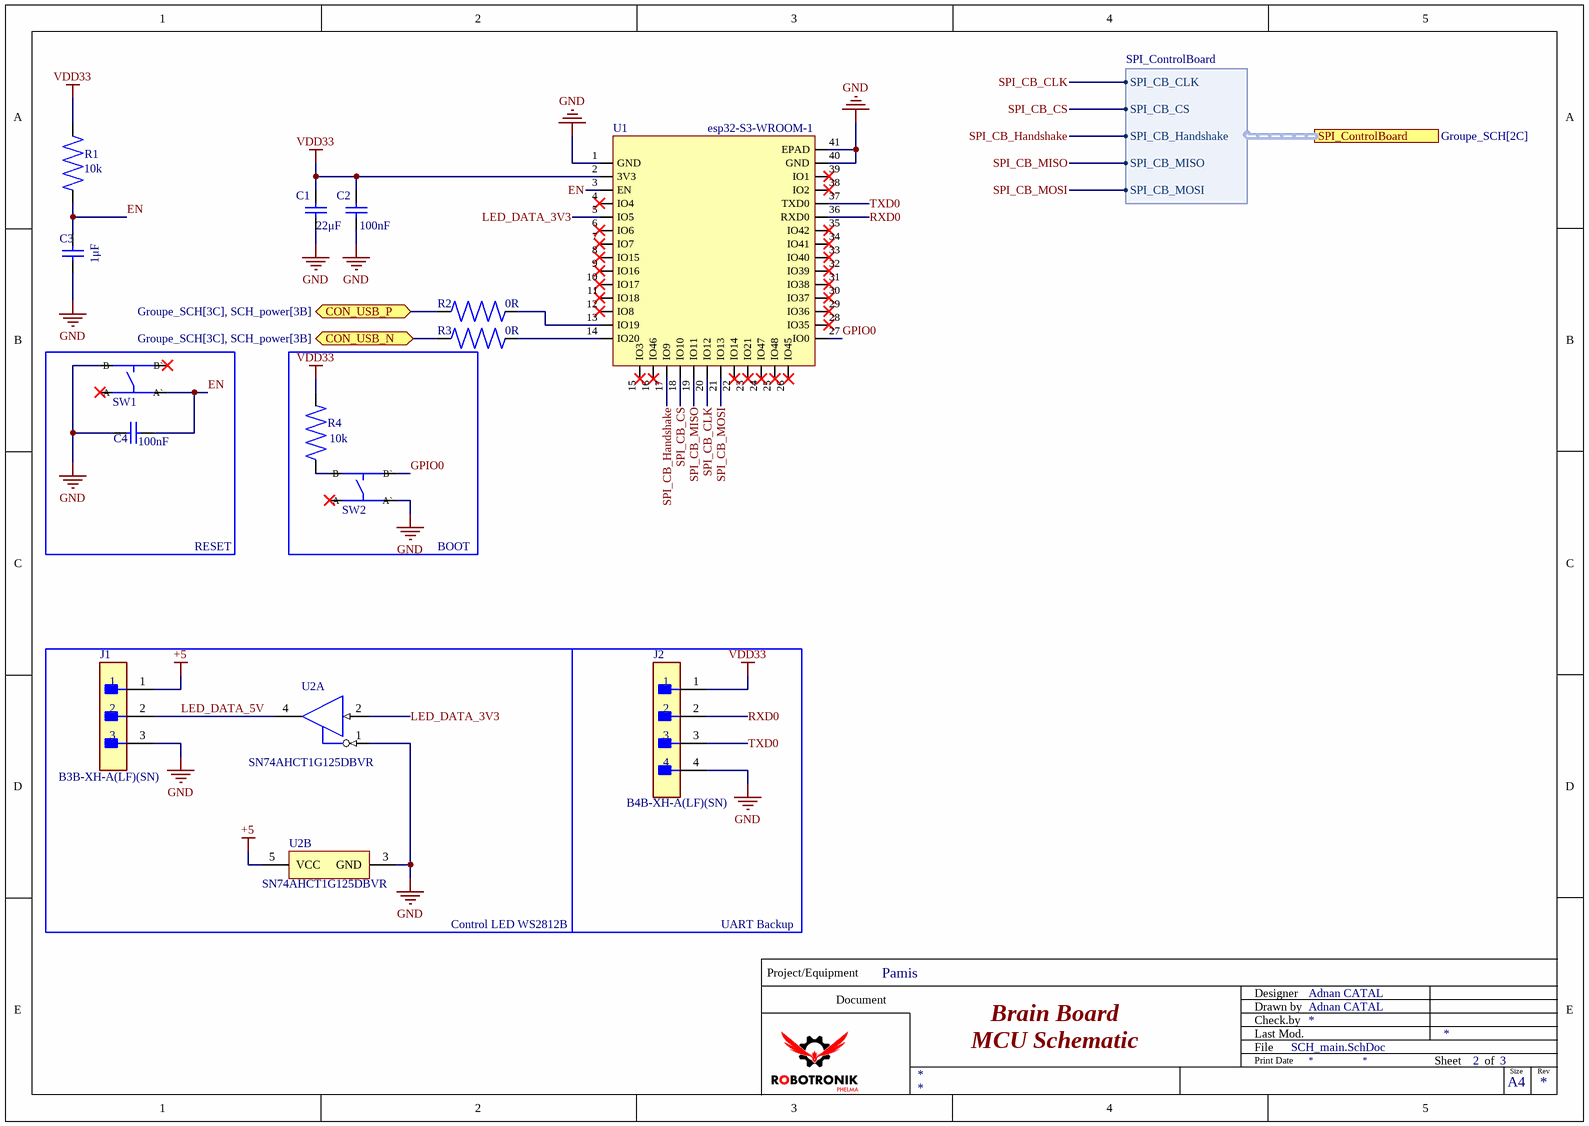
[diagram p2: SCH_main.SchDoc]

### Parts
C1  22μF  [WCAP-CSGP_0603_L1.6W0.8H0.8_Reflow]
C2  100nF  [WCAP-CSGP_0603_L1.6W0.8H0.8_Reflow]
C3  1μF  [WCAP-CSGP_0603_L1.6W0.8H0.8_Reflow]
C4  100nF  [WCAP-CSGP_0603_L1.6W0.8H0.8_Reflow]
J1  B3B-XH-A(LF)(SN)  [FP-B3B-XH-A_LF_SN-MFG]
J2  B4B-XH-A(LF)(SN)  [FP-B4B-XH-A_LF_SN-MFG]
R1  10k  [RESC1608X06N]
R2  0R  [RESC1608X06N]
R3  0R  [RESC1608X06N]
R4  10k  [RESC1608X06N]
SW1  EVQ-Q2S02W  [EVQQ2S02W]  (value not drawn)
SW2  EVQ-Q2S02W  [EVQQ2S02W]  (value not drawn)
U1  esp32-S3-WROOM-1  [XCVR_ESP32-S3-WROOM-1-N8R2]
U2  SN74AHCT1G125DBVR  [DBV0005A_L]  (parts A,B of 2)

### Blocks framed on the sheet
RESET: C4 SW1
BOOT: R4 SW2
Control LED WS2812B: J1 U2

### Ports
CON_USB_N (bidir, see Groupe_SCH[3C], SCH_power[3B]), CON_USB_P (bidir, see Groupe_SCH[3C], SCH_power[3B]), SPI_ControlBoard (harness SPI_ControlBoard, see Groupe_SCH[2C])

### Harnesses
SPI_ControlBoard: SPI_CB_MOSI, SPI_CB_MISO, SPI_CB_Handshake, SPI_CB_CS, SPI_CB_CLK

### Nets
+5: J1.1 U2.5(VCC)
GND: C1.1 C2.2 C3.1 C4.1 J1.3 J2.4 SW1.1(B) SW2.3(A`) U1.1(GND) U1.40(GND) U1.41(EPAD) U2.1(~{OE}) U2.3(GND)
VDD33: C1.2 C2.1 J2.1 R1.1 R4.2 U1.2(3V3)
CON_USB_N: R3.1 ; port CON_USB_N
CON_USB_P: R2.1 ; port CON_USB_P
EN: C3.2 C4.2 R1.2 SW1.3(A`) U1.3(EN)
GPIO0: SW2.4(B`) U1.27(IO0)
LED_DATA_3V3: U1.5(IO5) U2.2(A)
LED_DATA_5V: J1.2 U2.4(Y)
RXD0: J2.2 U1.36(RXD0)
SPI_CB_CLK: U1.20(IO12) ; port SPI_ControlBoard.SPI_CB_CLK
SPI_CB_CS: U1.18(IO10) ; port SPI_ControlBoard.SPI_CB_CS
SPI_CB_Handshake: U1.17(IO9) ; port SPI_ControlBoard.SPI_CB_Handshake
SPI_CB_MISO: U1.19(IO11) ; port SPI_ControlBoard.SPI_CB_MISO
SPI_CB_MOSI: U1.21(IO13) ; port SPI_ControlBoard.SPI_CB_MOSI
TXD0: J2.3 U1.37(TXD0)
NetR2_2: R2.2 U1.13(IO19)
NetR3_2: R3.2 U1.14(IO20)
NetR4_1: R4.1 SW2.1(B)

Not connected (* = marked no-connect by the designer): SW1 2(A)* 4(B`)*; SW2 2(A)*; U1 4(IO4)* 6(IO6)* 7(IO7)* 8(IO15)* 9(IO16)* 10(IO17)* 11(IO18)* 12(IO8)* 15(IO3)* 16(IO46)* 22(IO14)* 23(IO21)* 24(IO47)* 25(IO48)* 26(IO45)* 28(IO35)* 29(IO36)* 30(IO37)* 31(IO38)* 32(IO39)* 33(IO40)* 34(IO41)* 35(IO42)* 38(IO2)* 39(IO1)*

### Notes on the sheet
- UART Backup
- Project/Equipment
- Document
- Designer
- Drawn by
- Check.by
- File
- Last Mod.
- Print Date
- Sheet
- of
- Size
- A4
- Rev

### Library data of the parts
C1 = 885012106032: WCAP-CSGP Multilayer Ceramic Chip Capacitor, General Purpose, size 0603, 22μF, 10V; Manufacturer: Wurth Elektronik; Case/Size Code: 0603; Capacitance Tolerance: +/-20%; Ceramic Type: X5R Class II; Dissipation Factor: 20%; Insulation Resistance: 0.002GΩ; Technical Reference: X5R0603226M010DFCT10000; Manufacturer Part Number: 885012106032; Category: Multilayer Ceramic Chip Capacitors; Match Code: WCAP-CSGP; ComponentLink1Description: Website Link; ComponentLink1URL: https://www.we-online.com/redexpert/article/885012106032?ad; ComponentLink2Description: Datasheet Link; ComponentLink2URL: https://www.we-online.com/redexpert/spec/885012106032?ad; Mount: Surface Mount; Min Operating Temperature: -55°C; Max Operating Temperature: 85°C; Packaging: Tape and Reel; Length: 1.6mm; Width: 0.8mm; Height: 0.8mm; Capacitance: 22μF; Rated Voltage (DC): 10V
C2 C4 = 885012206046: WCAP-CSGP Multilayer Ceramic Chip Capacitor, General Purpose, size 0603, 100nF, 16V; Manufacturer: Wurth Elektronik; Case/Size Code: 0603; Capacitance Tolerance: +/-10%; Ceramic Type: X7R; Dissipation Factor: 3.5%; Insulation Resistance: 5GΩ; Technical Reference: X7R0603104K016DFCT10000; Manufacturer Part Number: 885012206046; Category: Multilayer Ceramic Chip Capacitors; Match Code: WCAP-CSGP; ComponentLink1Description: Website Link; ComponentLink1URL: https://www.we-online.com/redexpert/article/885012206046?ad; ComponentLink2Description: Datasheet Link; ComponentLink2URL: https://www.we-online.com/redexpert/spec/885012206046?ad; Mount: Surface Mount; Min Operating Temperature: -55°C; Max Operating Temperature: 125°C; Packaging: Tape and Reel; Length: 1.6mm; Width: 0.8mm; Height: 0.8mm; Capacitance: 100nF; Rated Voltage (DC): 16V
C3 = 885012106003: as C7 on sheet SCH_power; Manufacturer Part Number: 885012106003; Category: Multilayer Ceramic Chip Capacitors; Match Code: WCAP-CSGP; ComponentLink1Description: Website Link; ComponentLink1URL: https://www.we-online.com/redexpert/article/885012106003?ad; ComponentLink2Description: Datasheet Link; ComponentLink2URL: https://www.we-online.com/redexpert/spec/885012106003?ad; Mount: Surface Mount; Min Operating Temperature: -55°C; Max Operating Temperature: 85°C; Packaging: Tape and Reel; Length: 1.6mm; Width: 0.8mm; Height: 0.8mm; Capacitance: 1μF; Rated Voltage (DC): 6.3V
J1 = CMP-17439-000014-3: CONN HEADER VERT 3POS 2.5MM; Max Voltage Rating (DC): 250V; Number of Positions: 3; Current Rating: 3A; Gender: Male; Wire/Cable Gauge: 22AWG; Contact Resistance: 20mR; Insulation Resistance: 1GR; Insulation Material: Nylon; Contact Plating: Tin; Depth: 5.75mm; Contact Type: Male Pin; Max Operating Temperature: 85°C; Insulation Color: Natural; Voltage Rating (AC): 250V; Color: Natural; Connector Type: Header; Orientation: Straight; Fastening Type: Detent; Housing Color: White; Min Operating Temperature: -25°C; Termination: Solder; Voltage Rating: 250V; Series: XH; Pitch: 2.5mm; Contact Shape: Square; Number of Rows: 1; Lead Free: Lead Free; Packaging: Bulk; Mount: Through Hole; Flammability Rating: UL94 V-0; Max Voltage Rating (AC): 250V; REACH SVHC: No SVHC; Housing Material: Polyamide; Contact Material: Brass; Lead Pitch: 2.5mm; Contact Finish - Mating: TIN; Length: 9.9mm; Max Current Rating: 3A; Number of Contacts: 3
J2 = CMP-17439-000250-1: CONN HEADER VERT 4POS 2.5MM; Number of Contacts: 4; Contact Resistance: 20mR; Voltage Rating: 250V; Max Current Rating: 3A; Gender: Male; Wire/Cable Gauge: 22AWG; Mated Stacking Heights: 9.8mm; Insulation Resistance: 1GR; Orientation: Straight; Contact Type: Male Pin; Contact Finish - Mating: TIN; Series: XH; Max Voltage Rating (AC): 250V; Lead Pitch: 2.5mm; Contact Shape: Square; Insulation Color: Natural; Termination: Solder; Lead Free: Lead Free; Voltage Rating (AC): 250V; Number of Rows: 1; Flammability Rating: UL94 V-0; Number of Positions: 4; Max Operating Temperature: 85°C; Package Quantity: 500; Mount: Through Hole; REACH SVHC: No SVHC; Connector Type: Header; Insulation Material: Nylon; Fastening Type: Detent; Min Operating Temperature: -25°C; Housing Color: White; Packaging: Bulk; Contact Plating: Tin; Contact Material: Brass; Max Voltage Rating (DC): 250V; Housing Material: Polyamide; Color: Natural; Material: Polyamide; Pitch: 2.5mm; Depth: 5.75mm; Current Rating: 3A; Length: 12.4mm
R1 R4 = Resistance 10k 0603 1%: Tolerance: 1%; Power (W): 0,1; Value: 10k; Package: 0603
R2 R3 = Resistance 0R 0603 jumper: Power (W): 0,1; Value: 0R; Tolerance: -; Package: 0603
SW1 SW2 = EVQ-Q2S02W: Switch Tactile ON OFF SPST Round Button J-Bend 0.02A 15VDC 1.6N SMD Embossed T/R; Manufacturer: Panasonic; Manufacturer Lifecycle Status: ACTIVE; Actuator Length: 711.2µm; Actuator Material: Polyphthalamide; Contact Current Rating: 20mA; Contact Resistance: 100mΩ; Electrical Life: 1Mcycles; Illumination Type: Illuminated, Non-Illuminated; Max Voltage Rating (AC): 250V; Max Voltage Rating (DC): 15V; Number of Positions: 1; Switch Function: Off-Mom; Switch Travel: 250µm; Supplier: DigiKey; Supplier Part Number: P12951SCT-ND; Manufacturer Part Number: EVQ-Q2S02W; RoHS: Compliant; Category: Tactile Switches; Stock: 21774; Case/Package: SMD/SMT; Color: White; Contact Material: Brass, Stainless Steel; Contact Plating: Silver; Current Rating: 20mA; Depth: 6.6mm; Dielectric Material: Polyphthalamide; Height: 1.8mm; Housing Material: Stainless Steel; Insulation Resistance: 100MΩ; Lead Free: Lead Free; Length: 6.5mm; Life (Cycles): 1Mcycles; Lifecycle Status: Production; Max Current Rating: 20mA; Max Operating Temperature: 85°C; Mechanical Life: 1Mcycles; Min Operating Temperature: -40°C; Mounting Technology: Surface Mount; Operating Force: 1.6N; Radiation Hardening: No; REACH SVHC: Unaffected; Termination: Solder; Thickness: 1.8mm; Throw Configuration: SPST; Voltage Rating (AC): 250V; Voltage Rating (DC): 15V; Width: 6mm; ComponentLink1URL: https://datasheet.octopart.com:443/EVQ-Q2S02W-Panasonic-datasheet-138897726.pdf?src-supplier=Upverter; ComponentLink1Description: https://datasheet.octopart.com:443/EVQ-Q2S02W-Panasonic-datasheet-138897726.pdf?src-supplier=Upverter; ComponentLink2URL: https://datasheet.octopart.com:443/EVQ-Q2S02W-Panasonic-datasheet-59328990.pdf?src-supplier=IHS; ComponentLink2Description: https://datasheet.octopart.com:443/EVQ-Q2S02W-Panasonic-datasheet-59328990.pdf?src-supplier=IHS; ComponentLink3URL: https://datasheet.octopart.com/EVQ-Q2S02W-Panasonic-datasheet-13267673.pdf; ComponentLink3Description: https://datasheet.octopart.com/EVQ-Q2S02W-Panasonic-datasheet-13267673.pdf; ComponentLink4URL: https://datasheet.octopart.com:443/EVQ-Q2S02W-Panasonic-datasheet-41178988.pdf?src-supplier=element14+APAC; ComponentLink4Description: https://datasheet.octopart.com:443/EVQ-Q2S02W-Panasonic-datasheet-41178988.pdf?src-supplier=element14+APAC; ComponentLink5URL: https://datasheet.octopart.com:443/EVQ-Q2S02W-Panasonic-datasheet-130260655.pdf?src-supplier=TME; ComponentLink5Description: https://datasheet.octopart.com:443/EVQ-Q2S02W-Panasonic-datasheet-130260655.pdf?src-supplier=TME; ComponentLink6URL: https://datasheet.octopart.com:443/EVQ-Q2S02W-Panasonic-datasheet-78834757.pdf?src-supplier=Newark; ComponentLink6Description: https://datasheet.octopart.com:443/EVQ-Q2S02W-Panasonic-datasheet-78834757.pdf?src-supplier=Newark; ComponentLink7URL: https://datasheet.octopart.com:443/EVQQ2S02W-Panasonic-datasheet-5314136.pdf?src-supplier=Farnell; ComponentLink7Description: https://datasheet.octopart.com:443/EVQQ2S02W-Panasonic-datasheet-5314136.pdf?src-supplier=Farnell; ComponentLink8URL: https://datasheet.octopart.com:443/EVQ-Q2S02W-Panasonic-datasheet-106547821.pdf?src-supplier=Sager+Electronics; ComponentLink8Description: https://datasheet.octopart.com:443/EVQ-Q2S02W-Panasonic-datasheet-106547821.pdf?src-supplier=Sager+Electronics; ComponentLink9URL: https://datasheet.octopart.com:443/EVQ-Q2S02W-Panasonic-datasheet-98950118.pdf?src-supplier=Future+Electronics; ComponentLink9Description: https://datasheet.octopart.com:443/EVQ-Q2S02W-Panasonic-datasheet-98950118.pdf?src-supplier=Future+Electronics; ComponentLink10URL: https://datasheet.octopart.com:443/EVQ-Q2S02W-Panasonic-datasheet-118699.pdf?src-supplier=DigiKey; ComponentLink10Description: https://datasheet.octopart.com:443/EVQ-Q2S02W-Panasonic-datasheet-118699.pdf?src-supplier=DigiKey
U1 = esp32-S3-WROOM-1: Rf Txrx Module Bt Pcb Trace SMD; Manufacturer: Espressif Systems; Manufacturer Part Number: ESP32-S3-WROOM-1-N4; Max Supply Voltage: 3.6V; Min Supply Voltage: 3V; Nominal Supply Voltage (DC): 3.3V; Supplier: DigiKey; Supplier Part Number: 1965-ESP32-S3-WROOM-1-N4TR-ND; RoHS: Compliant; Category: RF Receivers, Transceivers; Country of Origin: Vietnam; Height - Seated (Max): 3.25mm; Harmonized Tariff Schedule (HTS) Code: 8542.31.00.30; Length: 25.5mm; Max Operating Temperature: 85°C; Min Operating Temperature: -40°C; Number of Terminals: 41; REACH SVHC: Unaffected; Terminal Pitch: 1.27mm; Width: 18mm; ComponentLink1URL: https://datasheet.octopart.com:443/ESP32-S3-WROOM-1-N4-Espressif-Systems-datasheet-165560563.pdf?src-supplier=IHS; ComponentLink1Description: https://datasheet.octopart.com:443/ESP32-S3-WROOM-1-N4-Espressif-Systems-datasheet-165560563.pdf?src-supplier=IHS; ComponentLink2URL: https://datasheet.octopart.com:443/ESP32-S3-WROOM-1-N4-Espressif-Systems-datasheet-192340060.pdf?src-supplier=LCSC; ComponentLink2Description: https://datasheet.octopart.com:443/ESP32-S3-WROOM-1-N4-Espressif-Systems-datasheet-192340060.pdf?src-supplier=LCSC; ComponentLink3URL: https://datasheet.octopart.com:443/ESP32-S3-WROOM-1-N4-Espressif-Systems-datasheet-188867343.pdf?src-supplier=TME; ComponentLink3Description: https://datasheet.octopart.com:443/ESP32-S3-WROOM-1-N4-Espressif-Systems-datasheet-188867343.pdf?src-supplier=TME; ComponentLink4URL: https://datasheet.octopart.com:443/ESP32-S3-WROOM-1-N4-Espressif-Systems-datasheet-165560559.pdf?src-supplier=TME; ComponentLink4Description: https://datasheet.octopart.com:443/ESP32-S3-WROOM-1-N4-Espressif-Systems-datasheet-165560559.pdf?src-supplier=TME
U2 = CMP-0859-00079-3: Single Bus Buffer Gate With 3-State Output, DBV0005A, LARGE T&R; Manufacturer: Texas Instruments; Voltage(Nom)(V): 5; Schmitt Trigger: No; F @ Nom Voltage(Max)(Mhz): 75; Technology Family: AHCT; Logic: True; VCC(Max)(V): 5.5; Input Type: CMOS; Sub-Family: Non-Inverting Buffer/Driver; ICC @ Nom Voltage(Max)(mA): 0.01; Output Drive (IOL/IOH)(Max)(mA): 8/-8; VCC(Min)(V): 2; Rating: Catalog; Bits(#): 1; tpd @ Nom Voltage(Max)(ns): 6; 3-State Output: Yes; PackageReference: DBV0005A; DatasheetVersion: SCLS378M; Generic Part Number: SN74AHCT1G125; Output Type: CMOS; Operating Temperature Range(C): -40 to 125

## Nets that join several sheets
+5: SCH_power (9 pins), SCH_main (J1.1 U2.5)
GND: Groupe_SCH (J4.7), SCH_power (35 pins), SCH_main (13 pins)
Vbat: Groupe_SCH (J4.6), SCH_power (C14.2 R12.2 U5.2)
VDD33: SCH_power (6 pins), SCH_main (6 pins)
CON_USB_N: SCH_power (D3.2 J3.A6 J3.B6), SCH_main (R3.1)
CON_USB_P: SCH_power (D2.2 J3.A7 J3.B7), SCH_main (R2.1)
SPI_CB_CLK: Groupe_SCH (J4.1), SCH_main (U1.20)
SPI_CB_CS: Groupe_SCH (J4.2), SCH_main (U1.18)
SPI_CB_Handshake: Groupe_SCH (J4.3), SCH_main (U1.17)
SPI_CB_MISO: Groupe_SCH (J4.4), SCH_main (U1.19)
SPI_CB_MOSI: Groupe_SCH (J4.5), SCH_main (U1.21)